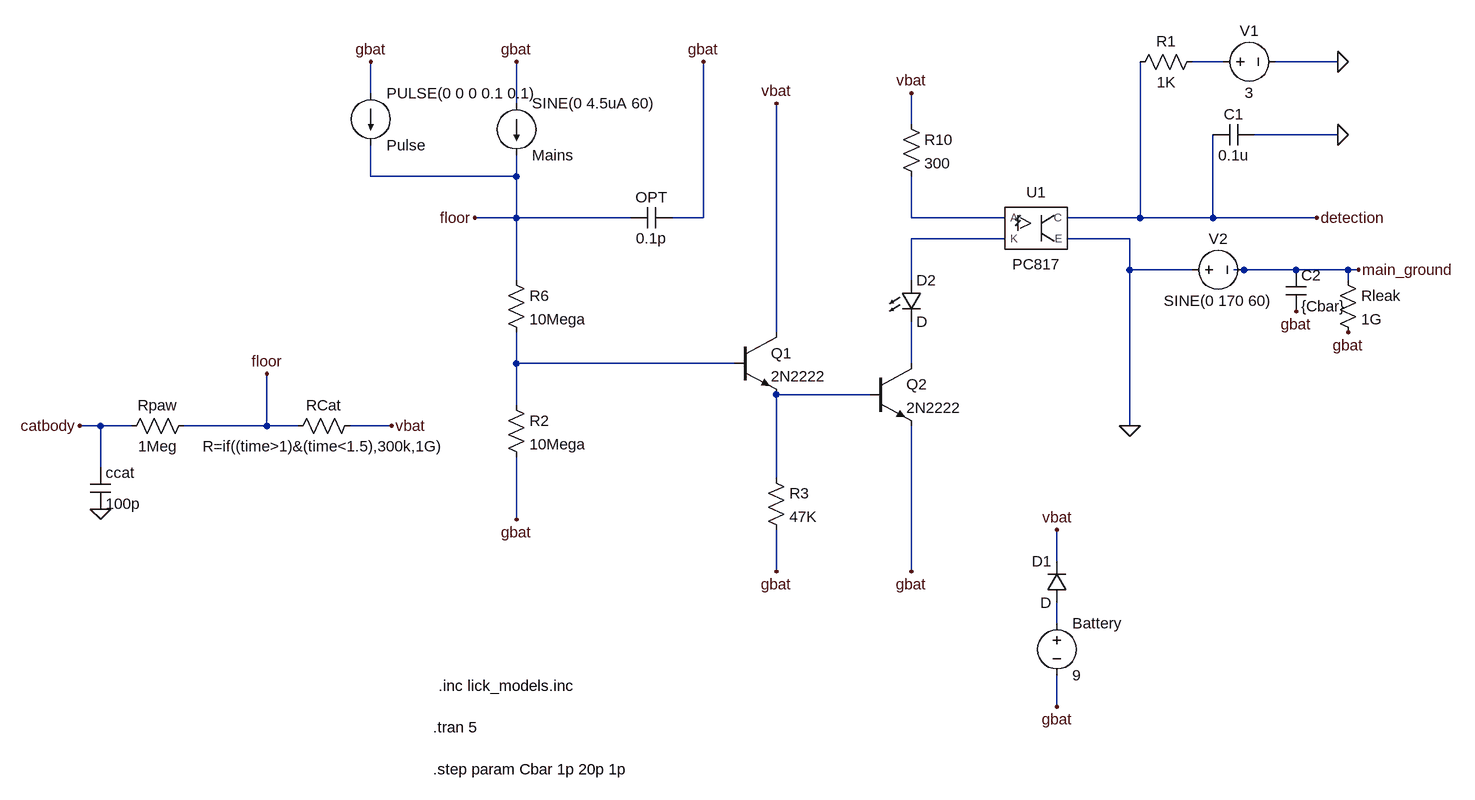
[diagram p0: schematic MyLickSensor.asc]
MyLickSensor.asc, the LTspice schematic file:
Version 4.1
SHEET 1 880 680
WIRE -880 -1536 -928 -1536
WIRE -704 -1536 -800 -1536
WIRE -2192 -1488 -2192 -1536
WIRE -1968 -1472 -1968 -1536
WIRE -1360 -1440 -1360 -1488
WIRE -704 -1424 -832 -1424
WIRE -2192 -1360 -2192 -1408
WIRE -1968 -1360 -1968 -1392
WIRE -1968 -1360 -2192 -1360
WIRE -1968 -1296 -1968 -1360
WIRE -1968 -1296 -2032 -1296
WIRE -1792 -1296 -1968 -1296
WIRE -1680 -1296 -1680 -1536
WIRE -1680 -1296 -1728 -1296
WIRE -1360 -1296 -1360 -1360
WIRE -1216 -1296 -1360 -1296
WIRE -1008 -1296 -1008 -1536
WIRE -1008 -1296 -1120 -1296
WIRE -896 -1296 -896 -1424
WIRE -896 -1296 -1008 -1296
WIRE -736 -1296 -896 -1296
WIRE -1216 -1264 -1360 -1264
WIRE -1024 -1264 -1120 -1264
WIRE -1024 -1216 -1024 -1264
WIRE -928 -1216 -1024 -1216
WIRE -848 -1216 -864 -1216
WIRE -768 -1216 -848 -1216
WIRE -688 -1216 -768 -1216
WIRE -672 -1216 -688 -1216
WIRE -1968 -1200 -1968 -1296
WIRE -1360 -1200 -1360 -1264
WIRE -688 -1200 -688 -1216
WIRE -1568 -1120 -1568 -1472
WIRE -1968 -1072 -1968 -1120
WIRE -1632 -1072 -1968 -1072
WIRE -1360 -1072 -1360 -1136
WIRE -1424 -1024 -1568 -1024
WIRE -1968 -1008 -1968 -1072
WIRE -2608 -976 -2640 -976
WIRE -2560 -976 -2608 -976
WIRE -2352 -976 -2352 -1056
WIRE -2352 -976 -2480 -976
WIRE -2304 -976 -2352 -976
WIRE -2160 -976 -2224 -976
WIRE -1024 -976 -1024 -1216
WIRE -2608 -912 -2608 -976
WIRE -1568 -896 -1568 -1024
WIRE -1968 -832 -1968 -928
WIRE -1136 -768 -1136 -816
WIRE -1568 -752 -1568 -816
WIRE -1360 -752 -1360 -976
WIRE -1136 -672 -1136 -704
WIRE -1136 -544 -1136 -592
FLAG -2032 -1296 floor
FLAG -1136 -816 vbat
FLAG -1568 -1472 vbat
FLAG -1360 -1488 vbat
FLAG -1024 -976 0
FLAG -736 -1296 detection
FLAG -704 -1536 0
FLAG -2352 -1056 floor
FLAG -2160 -976 vbat
FLAG -704 -1424 0
FLAG -2192 -1536 gbat
FLAG -1968 -1536 gbat
FLAG -1680 -1536 gbat
FLAG -1968 -832 gbat
FLAG -1568 -752 gbat
FLAG -1360 -752 gbat
FLAG -1136 -544 gbat
FLAG -672 -1216 main_ground
FLAG -768 -1152 gbat
FLAG -688 -1120 gbat
FLAG -2640 -976 catbody
FLAG -2608 -848 0
SYMBOL current -1968 -1472 R0
WINDOW 0 24 80 Left 2
WINDOW 3 24 0 Left 2
WINDOW 123 0 0 Left 0
WINDOW 39 0 0 Left 0
SYMATTR InstName Mains
SYMATTR Value SINE(0 4.5uA 60)
SYMBOL voltage -1136 -688 R0
WINDOW 123 0 0 Left 0
WINDOW 39 0 0 Left 0
SYMATTR InstName Battery
SYMATTR Value 9
SYMBOL cap -1728 -1312 R90
WINDOW 0 0 32 VBottom 2
WINDOW 3 32 32 VTop 2
SYMATTR InstName OPT
SYMATTR Value 0.1p
SYMBOL res -1984 -1216 R0
SYMATTR InstName R6
SYMATTR Value 10Mega
SYMBOL res -1984 -1024 R0
SYMATTR InstName R2
SYMATTR Value 10Mega
SYMBOL npn -1632 -1120 R0
SYMATTR InstName Q1
SYMATTR Value 2N2222
SYMBOL res -1584 -912 R0
SYMATTR InstName R3
SYMATTR Value 47K
SYMBOL diode -1120 -704 R180
WINDOW 0 24 64 Left 2
WINDOW 3 24 0 Left 2
SYMATTR InstName D1
SYMBOL LED -1376 -1200 R0
SYMATTR InstName D2
SYMBOL res -1376 -1456 R0
SYMATTR InstName R10
SYMATTR Value 300
SYMBOL npn -1424 -1072 R0
SYMATTR InstName Q2
SYMATTR Value 2N2222
SYMBOL PC817 -1216 -1312 R0
SYMATTR InstName U1
SYMBOL current -2192 -1488 R0
WINDOW 0 24 80 Left 2
WINDOW 3 24 0 Left 2
WINDOW 123 0 0 Left 0
WINDOW 39 0 0 Left 0
SYMATTR InstName Pulse
SYMATTR Value PULSE(0 0 0 0.1 0.1)
SYMBOL voltage -896 -1536 R270
WINDOW 0 32 56 VTop 2
WINDOW 3 -32 56 VBottom 2
WINDOW 123 0 0 Left 0
WINDOW 39 0 0 Left 0
SYMATTR InstName V1
SYMATTR Value 3
SYMBOL res -912 -1552 R90
WINDOW 0 0 56 VBottom 2
WINDOW 3 32 56 VTop 2
SYMATTR InstName R1
SYMATTR Value 1K
SYMBOL res -2208 -992 R90
WINDOW 0 0 56 VBottom 2
WINDOW 3 32 56 VTop 2
SYMATTR InstName RCat
SYMATTR Value R=if((time>1)&(time<1.5),300k,1G)
SYMBOL cap -832 -1440 R90
WINDOW 0 0 32 VBottom 2
WINDOW 3 32 32 VTop 2
SYMATTR InstName C1
SYMATTR Value 0.1u
SYMBOL voltage -944 -1216 R270
WINDOW 0 32 56 VTop 2
WINDOW 3 -32 56 VBottom 2
WINDOW 123 0 0 Left 0
WINDOW 39 0 0 Left 0
SYMATTR InstName V2
SYMATTR Value SINE(0 170 60)
SYMBOL cap -784 -1216 R0
SYMATTR InstName C2
SYMATTR Value {Cbar}
SYMBOL res -704 -1216 R0
SYMATTR InstName Rleak
SYMATTR Value 1G
SYMBOL res -2464 -992 R90
WINDOW 0 0 56 VBottom 2
WINDOW 3 32 56 VTop 2
SYMATTR InstName Rpaw
SYMATTR Value 1Meg
SYMBOL cap -2624 -912 R0
SYMATTR InstName ccat
SYMATTR Value 100p
TEXT -2088 -576 Left 2 !.inc lick_models.inc
TEXT -2096 -512 Left 2 !.tran 5
TEXT -2096 -448 Left 2 !.step param Cbar 1p 20p 1p

The netlist it stands for:
* MyLickSensor.asc
I§Mains gbat floor SINE(0 4.5uA 60)
V§Battery N007 gbat 9
C§OPT gbat floor 0.1p
R6 floor N004 10Mega
R2 N004 gbat 10Mega
Q1 vbat N004 N006 0 2N2222
R3 N006 gbat 47K
D1 N007 vbat D
D2 N003 N005 D
R10 vbat N002 300
Q2 N005 N006 gbat 0 2N2222
X§U1 N002 N003 detection 0 PC817  ; pins A K C E
I§Pulse gbat floor PULSE(0 0 0 0.1 0.1)
V1 N001 0 3
R1 N001 detection 1K
RCat vbat floor R=if((time>1)&(time<1.5),300k,1G)
C1 0 detection 0.1u
V2 0 main_ground SINE(0 170 60)
C2 main_ground gbat {Cbar}
Rleak main_ground gbat 1G
Rpaw floor catbody 1Meg
ccat catbody 0 100p
.model D D
.lib standard.dio
.model NPN NPN
.model PNP PNP
.lib standard.bjt
.inc lick_models.inc
.tran 5
.step param Cbar 1p 20p 1p
.backanno
.end